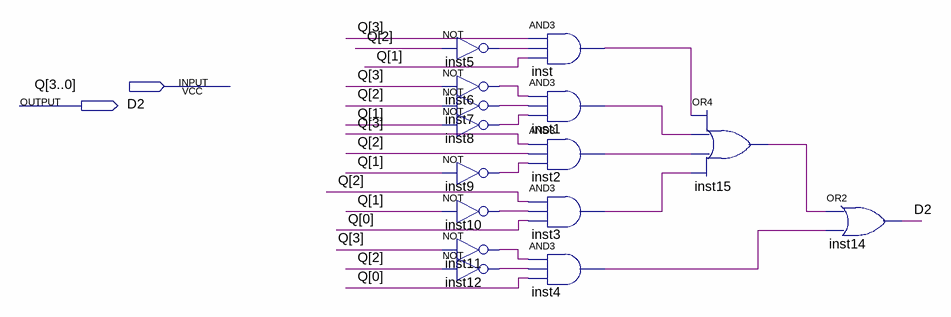
[diagram p0: schematic sheet]
// Quartus schematic d2_logic.bdf as structural Verilog: 15 symbols, 2 pins
module d2_logic (
  input  [3:0] Q,
  output D2
);

  wire inst1_out, inst2_out, inst3_out, inst4_out, inst5_out, inst6_out, inst7_out, inst8_out, inst9_out,
       inst10_out, inst11_out, inst12_out, inst15_out, inst_out;

  not inst5 (inst5_out, Q[2]);
  not inst6 (inst6_out, Q[3]);
  not inst7 (inst7_out, Q[2]);
  not inst8 (inst8_out, Q[1]);
  not inst9 (inst9_out, Q[1]);
  not inst10 (inst10_out, Q[1]);
  not inst11 (inst11_out, Q[3]);
  not inst12 (inst12_out, Q[2]);
  and inst (inst_out, Q[3], inst5_out, Q[1]);
  and inst1 (inst1_out, inst6_out, inst7_out, inst8_out);
  and inst2 (inst2_out, Q[3], Q[2], inst9_out);
  and inst3 (inst3_out, Q[2], inst10_out, Q[0]);
  and inst4 (inst4_out, inst11_out, inst12_out, Q[0]);
  or inst15 (inst15_out, inst_out, inst1_out, inst2_out, inst3_out);
  or inst14 (D2, inst15_out, inst4_out);
endmodule
